# Altium project Diff_Pair.PrjPcb
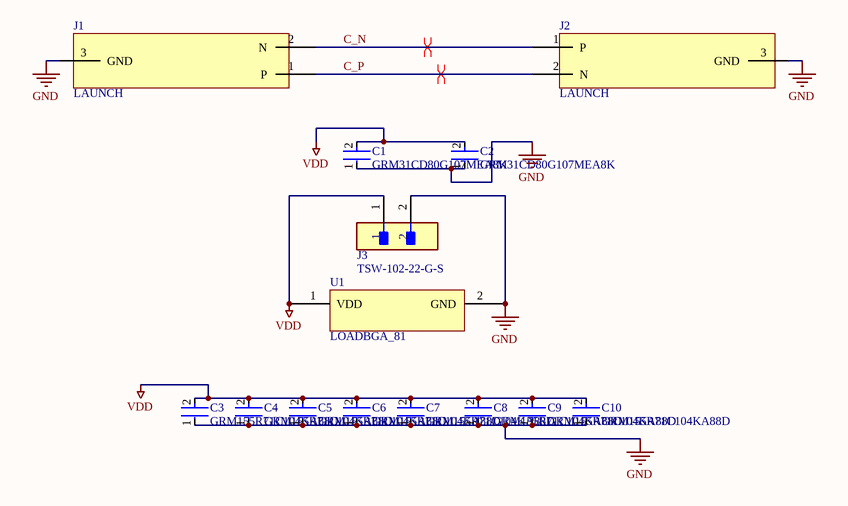
[diagram p0: Diff_Pair.SchDoc]
1 sheet, 14 parts. Net scope: global (net labels, ports and power ports of the same name join across sheets).
Board file: Diff_Pair.PcbDoc

## Sheet Diff_Pair.SchDoc
size A4; SheetNumber: 1; SheetTotal: 1

### Parts
C1  GRM31CD80G107MEA8K  [FP-GRM31C-0_3-e0_3_0_8-IPC_C]
C2  GRM31CD80G107MEA8K  [FP-GRM31C-0_3-e0_3_0_8-IPC_C]
C3  GRM155R71C104KA88D  [FP-GRM15-MFG]
C4  GRM155R71C104KA88D  [FP-GRM15-MFG]
C5  GRM155R71C104KA88D  [FP-GRM15-MFG]
C6  GRM155R71C104KA88D  [FP-GRM15-MFG]
C7  GRM155R71C104KA88D  [FP-GRM15-MFG]
C8  GRM155R71C104KA88D  [FP-GRM15-MFG]
C9  GRM155R71C104KA88D  [FP-GRM15-MFG]
C10  GRM155R71C104KA88D  [FP-GRM15-MFG]
J1  LAUNCH  [LAUNCH_FP]
J2  LAUNCH  [LAUNCH_FP]
J3  TSW-102-22-G-S  [FP-TSW-102-22-G-S-MFG]
U1  LOADBGA_81  [BGA81_LOAD]

### Nets
GND: C1.1 C2.1 C3.1 C4.1 C5.1 C6.1 C7.1 C8.1 C9.1 C10.1 J1.3(GND) J2.3(GND) J3.2 U1.2(GND)
VDD: C1.2 C2.2 C3.2 C4.2 C5.2 C6.2 C7.2 C8.2 C9.2 C10.2 J3.1 U1.1(VDD)
C_N: J1.2(N) J2.1(P)
C_P: J1.1(P) J2.2(N)

### Layout directives
differential pair: C_N, C_P

### Library data of the parts
C1 C2 = CMP-06035-051614-1: Chip Multilayer Ceramic Capacitors for General Purpose, 1206, 100uF, X6T, +22%/-33%, 20%, 4V
C3-C10 = CMP-2100-03641-2: CAP CER 0.1UF 16V X7R 0402; Manufacturer: Murata; Standoff Height: 0mm; Tolerance: 10%; Description: CAP Ceramic 0.10μF 10% X7R 16Vdc 0402 SMD; Voltage Rating: 16Vdc; Material: Ceramic; Capacitance: 0.10μF; Value: 0.10μF; RoHS: TRUE; Manufacturer Part Number: GRM155R71C104KA88D; Temperature Characteristic: X7R; Octopart: https://octopart.com/grm155r71c104ka88d-murata-196880; Digikey Description: CAP CER 0.1UF 16V X7R 0402; Device Class L3: Ceramic Capacitors; Height: 0.55mm; ComponentLink2Description: Datasheet; Temperature Range Low: -55°C; Ipc Land Pattern Name: CAPC10050X219; ComponentLink2URL: https://search.murata.co.jp/Ceramy/image/img/A01X/G101/ENG/GRM155R71H471KA01-01A.pdf; Device Class L1: Passive Components; Lead Free: yes; Category: Cap; Package: GRM15; Temperature: -55°C to +125°C; Device Class L2: Capacitors; Temperature Range High: +125°C; Mouser Description: 0402 0.1 uF 16V ±10 % Tolerance X7R SMT Multilayer Ceramic Capacitor
J3 = CMP-02766-000117-1: CONN HEADER VERT 2POS 2.54MM; Max Voltage Rating (AC): 550V; Gender: Male; Max Current Rating: 7.6A; Number of Contacts: 2; Housing Color: Black; Max Operating Temperature: 125°C; Orientation: Straight; Depth: 2.54mm; Pitch: 2.54mm; Housing Material: Polyester; Packaging: Bulk; Termination: Solder; Contact Plating: Gold; Length: 5.08mm; Number of Rows: 1; Radiation Hardening: No; Min Operating Temperature: -55°C; REACH SVHC: No SVHC; Contact Material: Bronze
U1 = LOAD_BGA81